# Altium schematic sheet 04_MCU.SchDoc: ESP32-S3, USB y programación
size 420 x 297 mm; Address1: Hardware en IoT · 2026; SheetNumber: 4; SheetTotal: 6
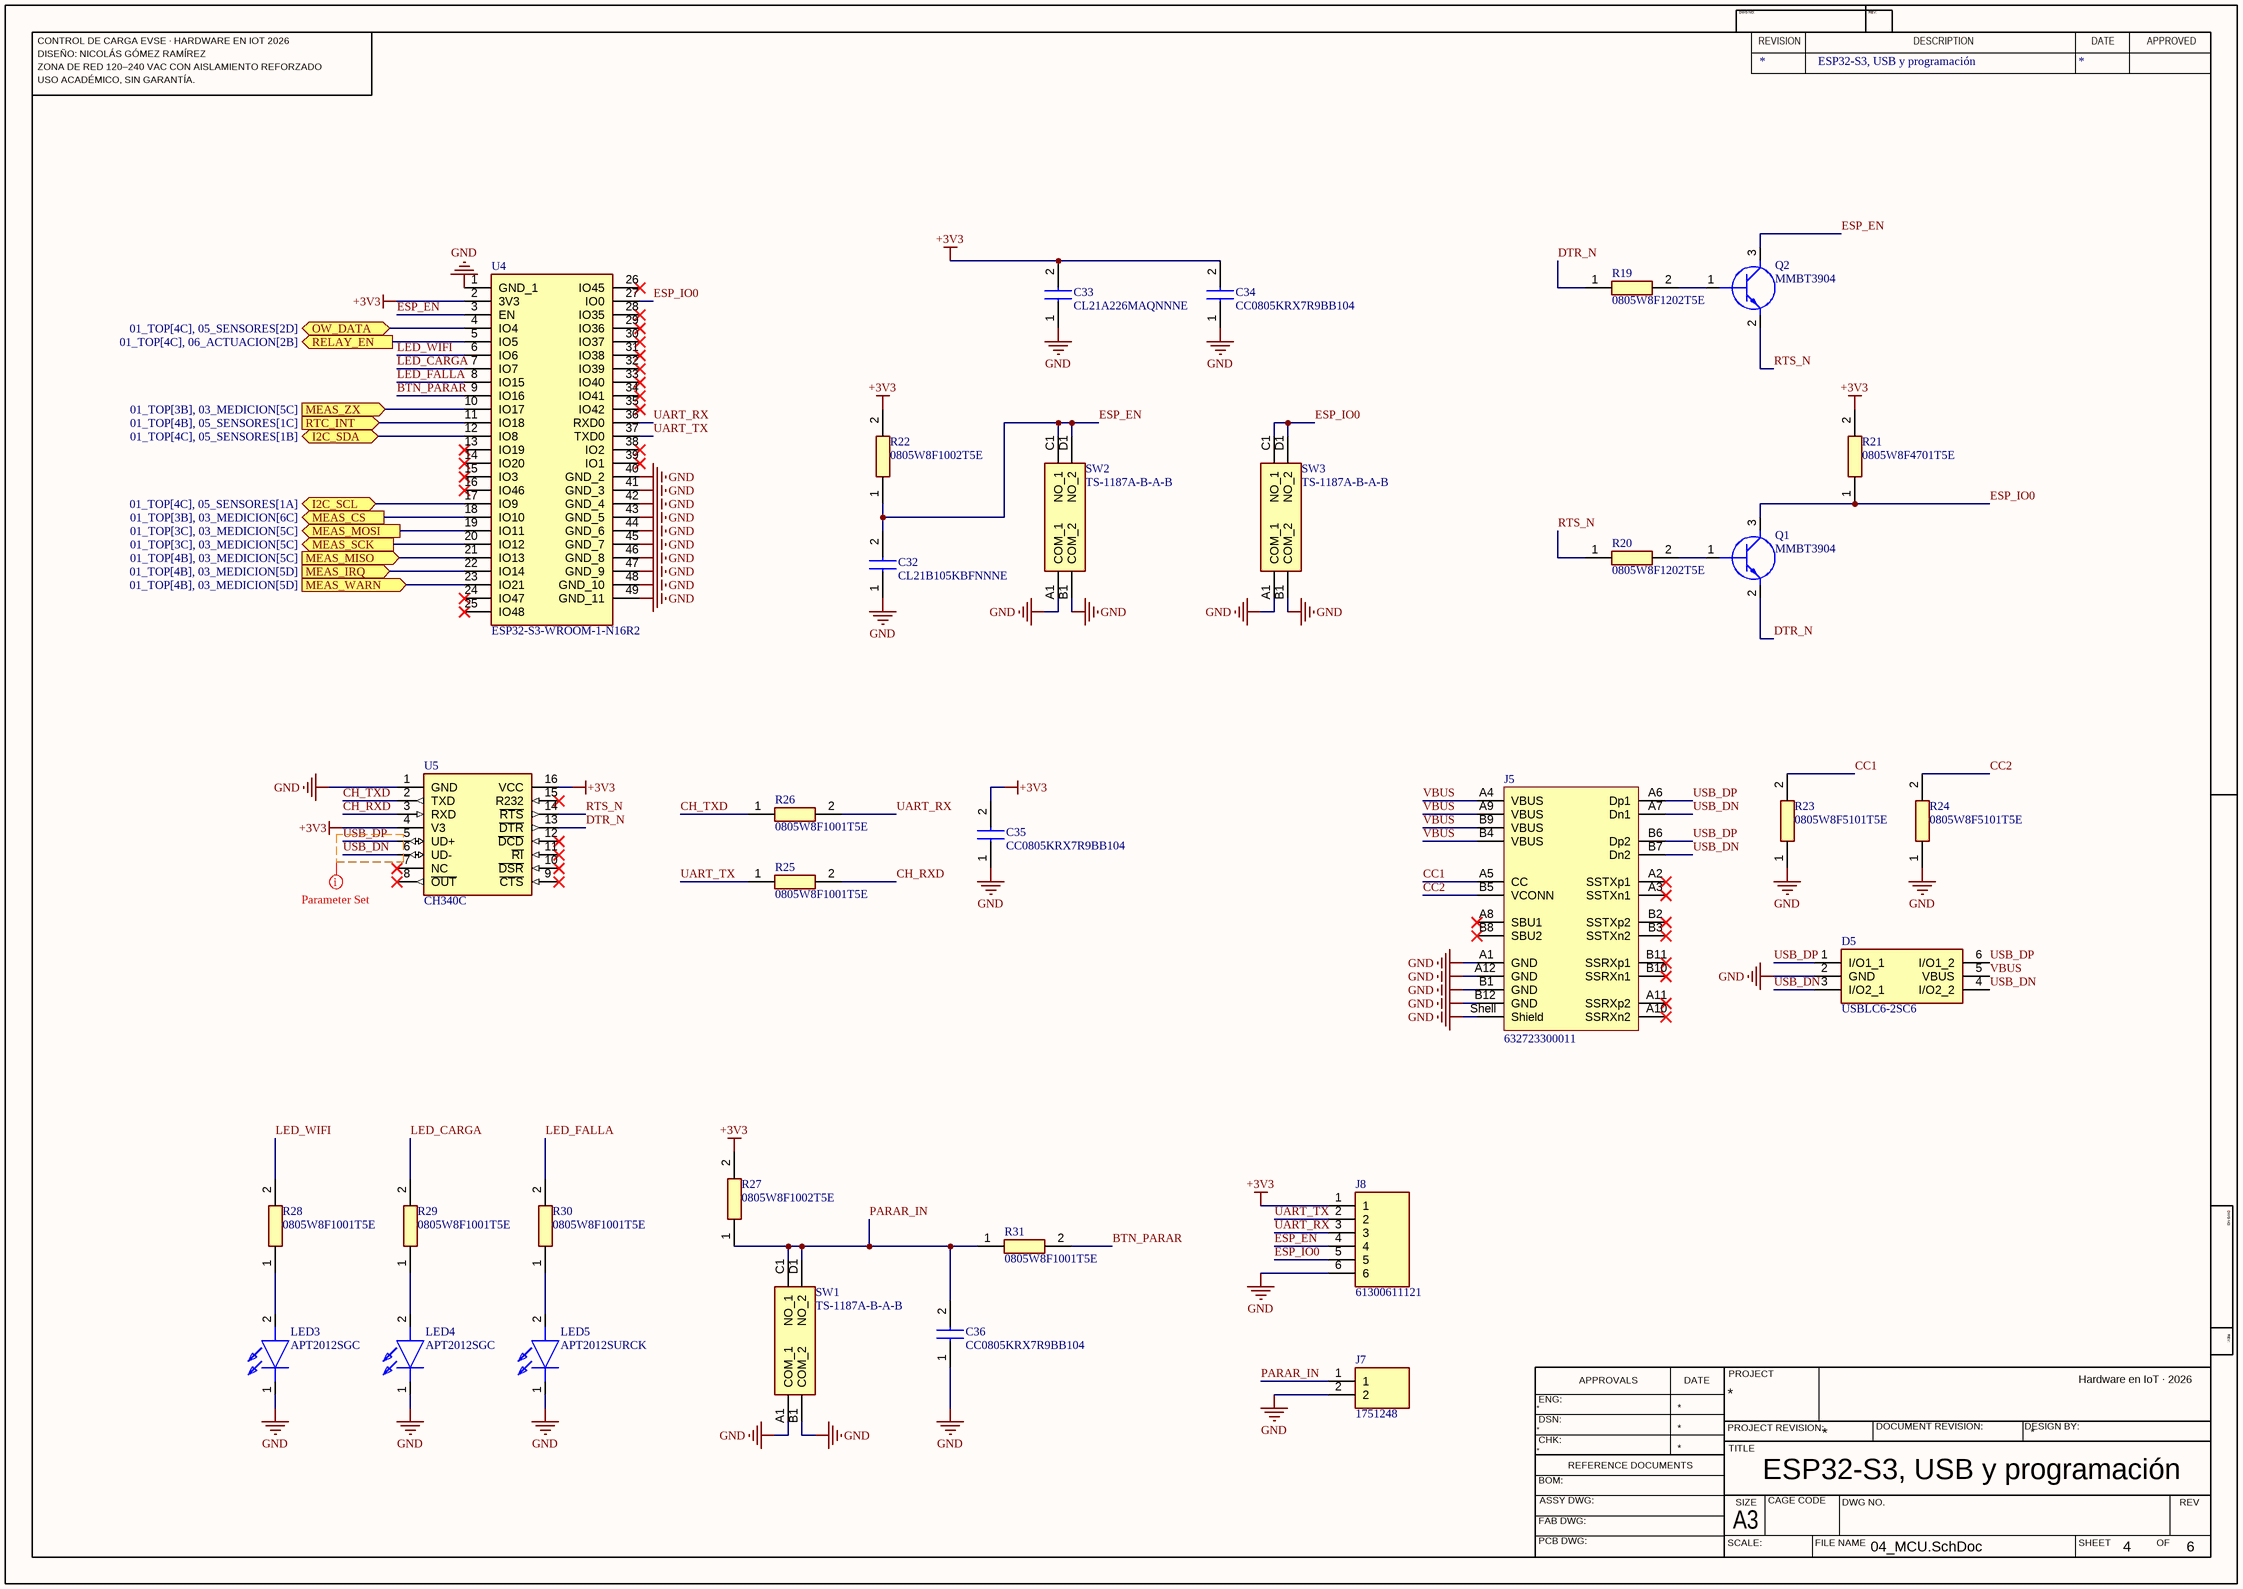
[diagram p0: 04_MCU.SchDoc]

## Parts
C32  CL21B105KBFNNNE  [CAPC2012X88N]
C33  CL21A226MAQNNNE  [CAPC2012X140N]
C34  CC0805KRX7R9BB104  [CAPC2012X88N]
C35  CC0805KRX7R9BB104  [CAPC2012X88N]
C36  CC0805KRX7R9BB104  [CAPC2012X88N]
D5  USBLC6-2SC6  [SOT95P280X145-6N]
J5  632723300011  [632723300011]
J7  1751248  [1751248]
J8  61300611121  [HDRV6W79P0X254_1X6_1524X254X894P]
LED3  APT2012SGC  [LEDC2012X85N]
LED4  APT2012SGC  [LEDC2012X85N]
LED5  APT2012SURCK  [LEDC2012X85N]
Q1  MMBT3904  [SOT96P237X111-3N]
Q2  MMBT3904  [SOT96P237X111-3N]
R19  0805W8F1202T5E  [RESC2012X60N]
R20  0805W8F1202T5E  [RESC2012X60N]
R21  0805W8F4701T5E  [RESC2012X60N]
R22  0805W8F1002T5E  [RESC2012X60N]
R23  0805W8F5101T5E  [RESC2012X60N]
R24  0805W8F5101T5E  [RESC2012X60N]
R25  0805W8F1001T5E  [RESC2012X60N]
R26  0805W8F1001T5E  [RESC2012X60N]
R27  0805W8F1002T5E  [RESC2012X60N]
R28  0805W8F1001T5E  [RESC2012X60N]
R29  0805W8F1001T5E  [RESC2012X60N]
R30  0805W8F1001T5E  [RESC2012X60N]
R31  0805W8F1001T5E  [RESC2012X60N]
SW1  TS-1187A-B-A-B  [TS1187ABAB]
SW2  TS-1187A-B-A-B  [TS1187ABAB]
SW3  TS-1187A-B-A-B  [TS1187ABAB]
U4  ESP32-S3-WROOM-1-N16R2  [ESP32S3WROOM1N16R2]
U5  CH340C  [SOIC127P600X175-16N]

## Ports
I2C_SCL (bidir, see 01_TOP[4C], 05_SENSORES[1A]), I2C_SDA (bidir, see 01_TOP[4C], 05_SENSORES[1B]), MEAS_CS (out, see 01_TOP[3B], 03_MEDICION[6C]), MEAS_IRQ (in, see 01_TOP[4B], 03_MEDICION[5D]), MEAS_MISO (in, see 01_TOP[4B], 03_MEDICION[5C]), MEAS_MOSI (out, see 01_TOP[3C], 03_MEDICION[5C]), MEAS_SCK (out, see 01_TOP[3C], 03_MEDICION[5C]), MEAS_WARN (in, see 01_TOP[4B], 03_MEDICION[5D]), MEAS_ZX (in, see 01_TOP[3B], 03_MEDICION[5C]), OW_DATA (bidir, see 01_TOP[4C], 05_SENSORES[2D]), RELAY_EN (out, see 01_TOP[4C], 06_ACTUACION[2B]), RTC_INT (in, see 01_TOP[4B], 05_SENSORES[1C])

## Nets
+3V3: C33.2 C34.2 C35.2 J8.1 R21.2 R22.2 R27.2 U4.2(3V3) U5.4(V3) U5.16(VCC)
GND: C32.1 C33.1 C34.1 C35.1 C36.1 D5.2(GND) J5.A1(GND) J5.A12(GND) J5.B1(GND) J5.B12(GND) J5.Shell(Shield) J7.2 J8.6 LED3.1(K) LED4.1(K) LED5.1(K) R23.1 R24.1 SW1.A1(COM_1) SW1.B1(COM_2) SW2.A1(COM_1) SW2.B1(COM_2) SW3.A1(COM_1) SW3.B1(COM_2) U4.1(GND_1) U4.40(GND_2) U4.41(GND_3) U4.42(GND_4) U4.43(GND_5) U4.44(GND_6) U4.45(GND_7) U4.46(GND_8) U4.47(GND_9) U4.48(GND_10) U4.49(GND_11) U5.1(GND)
BTN_PARAR: R31.2 U4.9(IO16)
CC1: J5.A5(CC) R23.2
CC2: J5.B5(VCONN) R24.2
CH_RXD: R25.2 U5.3(RXD)
CH_TXD: R26.1 U5.2(TXD)
DTR_N: Q1.2(E) R19.1 U5.13(~{DTR})
ESP_EN: C32.2 J8.4 Q2.3(C) R22.1 SW2.C1(NO_1) SW2.D1(NO_2) U4.3(EN)
ESP_IO0: J8.5 Q1.3(C) R21.1 SW3.C1(NO_1) SW3.D1(NO_2) U4.27(IO0)
I2C_SCL: U4.17(IO9) ; port I2C_SCL
I2C_SDA: U4.12(IO8) ; port I2C_SDA
LED_CARGA: R29.2 U4.7(IO7)
LED_FALLA: R30.2 U4.8(IO15)
LED_WIFI: R28.2 U4.6(IO6)
MEAS_CS: U4.18(IO10) ; port MEAS_CS
MEAS_IRQ: U4.22(IO14) ; port MEAS_IRQ
MEAS_MISO: U4.21(IO13) ; port MEAS_MISO
MEAS_MOSI: U4.19(IO11) ; port MEAS_MOSI
MEAS_SCK: U4.20(IO12) ; port MEAS_SCK
MEAS_WARN: U4.23(IO21) ; port MEAS_WARN
MEAS_ZX: U4.10(IO17) ; port MEAS_ZX
OW_DATA: U4.4(IO4) ; port OW_DATA
PARAR_IN: C36.2 J7.1 R27.1 R31.1 SW1.C1(NO_1) SW1.D1(NO_2)
RELAY_EN: U4.5(IO5) ; port RELAY_EN
RTC_INT: U4.11(IO18) ; port RTC_INT
RTS_N: Q2.2(E) R20.1 U5.14(~{RTS})
UART_RX: J8.3 R26.2 U4.36(RXD0)
UART_TX: J8.2 R25.1 U4.37(TXD0)
USB_DN: D5.3(I/O2_1) D5.4(I/O2_2) J5.A7(Dn1) J5.B7(Dn2) U5.6(UD-)
USB_DP: D5.1(I/O1_1) D5.6(I/O1_2) J5.A6(Dp1) J5.B6(Dp2) U5.5(UD+)
VBUS: D5.5(VBUS) J5.A4(VBUS) J5.A9(VBUS) J5.B4(VBUS) J5.B9(VBUS)
NetLED3_2: LED3.2(A) R28.1
NetLED4_2: LED4.2(A) R29.1
NetLED5_2: LED5.2(A) R30.1
NetQ1_1: Q1.1(B) R20.2
NetQ2_1: Q2.1(B) R19.2

Not connected (* = marked no-connect by the designer): J5 A2(SSTXp1)* A3(SSTXn1)* A8(SBU1)* A10(SSRXn2)* A11(SSRXp2)* B2(SSTXp2)* B3(SSTXn2)* B8(SBU2)* B10(SSRXn1)* B11(SSRXp1)*; U4 13(IO19)* 14(IO20)* 15(IO3)* 16(IO46)* 24(IO47)* 25(IO48)* 26(IO45)* 28(IO35)* 29(IO36)* 30(IO37)* 31(IO38)* 32(IO39)* 33(IO40)* 34(IO41)* 35(IO42)* 38(IO2)* 39(IO1)*; U5 7(NC)* 8(~{OUT})* 9(~{CTS})* 10(~{DSR})* 11(~{RI})* 12(~{DCD})* 15(R232)*

## Layout directives
net class USB: USB_DN, USB_DP

## Notes on the sheet
- CONTROL DE CARGA EVSE · HARDWARE EN IOT 2026
- DISEÑO: NICOLÁS GÓMEZ RAMÍREZ
- DWG NO:
- REVISION
- REV:
- DESCRIPTION
- DATE
- APPROVED
- ZONA DE RED 120–240 VAC CON AISLAMIENTO REFORZADO
- USO ACADÉMICO, SIN GARANTÍA.
- ENG:
- APPROVALS
- PROJECT
- DSN:
- CHK:
- REFERENCE DOCUMENTS
- PROJECT REVISION:
- TITLE
- DOCUMENT REVISION:
- DESIGN BY:
- BOM:
- FAB DWG:
- PCB DWG:
- ASSY DWG:
- SCALE:
- A3
- SIZE
- CAGE CODE
- FILE NAME
- DWG NO.
- SHEET
- OF
- REV

## Library data of the parts
C32 = CL21B105KBFNNNE: Capacitor 1 uF 50 V X7R 10% 0805; Manufacturer_Name: Samsung Electro-Mechanics; Assembly: JLCPCB; Manufacturer_Part_Number: CL21B105KBFNNNE; Supplier: JLCPCB; Supplier PN: LCSC C28323; Value: 1uF 50V X7R
C33 = CL21A226MAQNNNE: Capacitor; Manufacturer_Name: Samsung Electro-Mechanics; Assembly: JLCPCB; Value: 22uF 25V; Datasheet Link: https://datasheet.datasheetarchive.com/originals/distributors/Datasheets-DGA10/2406310.pdf; Height: 1.4mm; Manufacturer_Part_Number: CL21A226MAQNNNE; Supplier: JLCPCB; Supplier PN: LCSC C45783
C34-C36 = CC0805KRX7R9BB104: Capacitor 100 nF 50 V X7R 10% 0805; Manufacturer_Name: YAGEO; Assembly: JLCPCB; Manufacturer_Part_Number: CC0805KRX7R9BB104; Supplier: JLCPCB; Supplier PN: LCSC C49678; Value: 100nF 50V X7R
D5 = USBLC6-2SC6: Integrated Circuit; Manufacturer_Name: STMicroelectronics; Value: ESD USB; Assembly: JLCPCB; Supplier: JLCPCB; Supplier PN: LCSC C7519; Datasheet Link: https://www.st.com/resource/en/datasheet/usblc6-2.pdf; Height: 1.45mm; Manufacturer_Part_Number: USBLC6-2SC6
J5 = CMP-1502-03214-4: Conn USB 3.1 Type C RCP 24 POS 0.5mm/0.4mm Solder RA SMD/Thru-Hole 24 Terminal 1 Port T/R; Manufacturer_Name: Wurth Elektronik; Gender: Receptacle; Pin Length: 1.9mm; Insulation Resistance: 1GΩ; Current Rating: 5A; USB Standard: USB 3.1; Contact Resistance: 30mΩ; Voltage Rating: 20V; Number of Contacts: 24; Value: USB-C 16P USB2.0; Assembly: JLCPCB; Orientation: Horizontal; Mount: Surface Mount, Through Hole; Connector Type: USB; Number of Pins: 24; Height: 3.21mm; Max Operating Temperature: 105°C; Contact Material: Gold, Nickel; RoHS: Compliant; Min Operating Temperature: -40°C; Packaging: Tape and Reel; Manufacturer_Part_Number: 632723300011; Supplier: JLCPCB; Supplier PN: LCSC C2830802
J7 = 1751248: Connector; Manufacturer_Name: Phoenix Contact; Assembly: JLCPCB; Value: 2P 3.5mm; Datasheet Link: https://www.phoenixcontact.com/en-us/products/printed-circuit-board-terminal-mkds-1-2-35-1751248?type=pdf; Height: 8.65mm; Manufacturer_Part_Number: 1751248; Supplier: JLCPCB; Supplier PN: LCSC C89122
J8 = 61300611121: Connector; Manufacturer_Name: Wurth Elektronik; Value: 1x6 2.54mm; Assembly: JLCPCB; Datasheet Link: https://www.we-online.com/components/products/datasheet/61300611121.pdf; Height: 8.94mm; Manufacturer_Part_Number: 61300611121; Supplier: JLCPCB; Supplier PN: LCSC C5444523
LED3 LED4 = APT2012SGC: LED; Manufacturer_Name: Kingbright; Assembly: JLCPCB; Value: verde; Datasheet Link: http://www.us.kingbright.com/images/catalog/SPEC/APT2012SGC.pdf; Height: 0.85mm; Manufacturer_Part_Number: APT2012SGC; Supplier: JLCPCB; Supplier PN: LCSC C5353439
LED5 = APT2012SURCK: LED; Manufacturer_Name: Kingbright; Assembly: JLCPCB; Value: rojo; Manufacturer_Part_Number: APT2012SURCK; Supplier: JLCPCB; Supplier PN: LCSC C5875730
Q1 Q2 = MMBT3904: Transistor BJT NPN 40 V 200 mA, SOT-23; Manufacturer_Name: Jiangsu Changjing Electronics; Value: NPN 40V 0.2A; Assembly: JLCPCB; Manufacturer_Part_Number: MMBT3904; Supplier: JLCPCB; Supplier PN: LCSC C20526
R19 R20 = 0805W8F1202T5E: Resistor 12 kOhm 1% 125 mW 0805; Manufacturer_Name: UNI-ROYAL; Value: 12k; Assembly: JLCPCB; Manufacturer_Part_Number: 0805W8F1202T5E; Supplier: JLCPCB; Supplier PN: LCSC C17444
R21 = 0805W8F4701T5E: Resistor 4.7 kOhm 1% 125 mW 0805; Manufacturer_Name: UNI-ROYAL; Value: 4.7k; Assembly: JLCPCB; Manufacturer_Part_Number: 0805W8F4701T5E; Supplier: JLCPCB; Supplier PN: LCSC C17673
R22 R27 = 0805W8F1002T5E: Resistor 10 kOhm 1% 125 mW 0805; Manufacturer_Name: UNI-ROYAL; Value: 10k; Assembly: JLCPCB; Manufacturer_Part_Number: 0805W8F1002T5E; Supplier: JLCPCB; Supplier PN: LCSC C17414
R23 R24 = 0805W8F5101T5E: Resistor 5.1 kOhm 1% 125 mW 0805; Manufacturer_Name: UNI-ROYAL; Value: 5.1k; Assembly: JLCPCB; Manufacturer_Part_Number: 0805W8F5101T5E; Supplier: JLCPCB; Supplier PN: LCSC C27834
R25 R26 R28-R31 = 0805W8F1001T5E: Resistor 1 kOhm 1% 125 mW 0805; Manufacturer_Name: UNI-ROYAL; Assembly: JLCPCB; Value: 1k; Manufacturer_Part_Number: 0805W8F1001T5E; Supplier: JLCPCB; Supplier PN: LCSC C17513
SW1 = TS-1187A-B-A-B: Tact switch 5.1 x 5.1 x 1.5 mm, 160 gf, 50 mA 12 VDC; Manufacturer_Name: XKB Connectivity; Value: pulsador 5.1mm; Assembly: JLCPCB; Supplier: JLCPCB; Supplier PN: LCSC C318884; Datasheet Link: http://www.helloxkb.com/public/images/pdf/TS-1187A-X-X-X.pdf; Height: 4.05mm; Manufacturer_Part_Number: TS-1187A-B-A-B
SW2 SW3 = TS-1187A-B-A-B: Tact switch 5.1 x 5.1 x 1.5 mm, 160 gf, 50 mA 12 VDC; Manufacturer_Name: XKB Connectivity; Value: pulsador 5.1mm; Assembly: DNP; Supplier: JLCPCB; Supplier PN: LCSC C318884; Datasheet Link: http://www.helloxkb.com/public/images/pdf/TS-1187A-X-X-X.pdf; Height: 4.05mm; Manufacturer_Part_Number: TS-1187A-B-A-B
U4 = ESP32-S3-WROOM-1-N16R2: Integrated Circuit; Manufacturer_Name: Espressif Systems; Value: N16R2 16MB/2MB; Assembly: JLCPCB; Datasheet Link: https://www.espressif.com/sites/default/files/documentation/esp32-s3-wroom-1_wroom-1u_datasheet_en.pdf; Height: 3.25mm; Manufacturer_Part_Number: ESP32-S3-WROOM-1-N16R2; Supplier: JLCPCB; Supplier PN: LCSC C2913205
U5 = CH340C: USB to UART bridge; Manufacturer_Name: WCH; Value: USB-UART; Assembly: JLCPCB; Supplier PN: LCSC C84681; Supplier: JLCPCB; Datasheet Link: https://www.wch-ic.com/downloads/CH340DS1_PDF.html; Height: 1.75mm; Manufacturer_Part_Number: CH340C